# Altium schematic sheet starfish_4.SchDoc: starfish
size 282 x 208 mm; Origin: Eagle; Date: 4/18/2022 11:53:22 PM; SheetNumber: 5; GateName_1: G$1; SymbolName_1: A4L-LOC; LibraryName: frames; DeviceSetName: A4L-LOC; Sheet: Sheet:
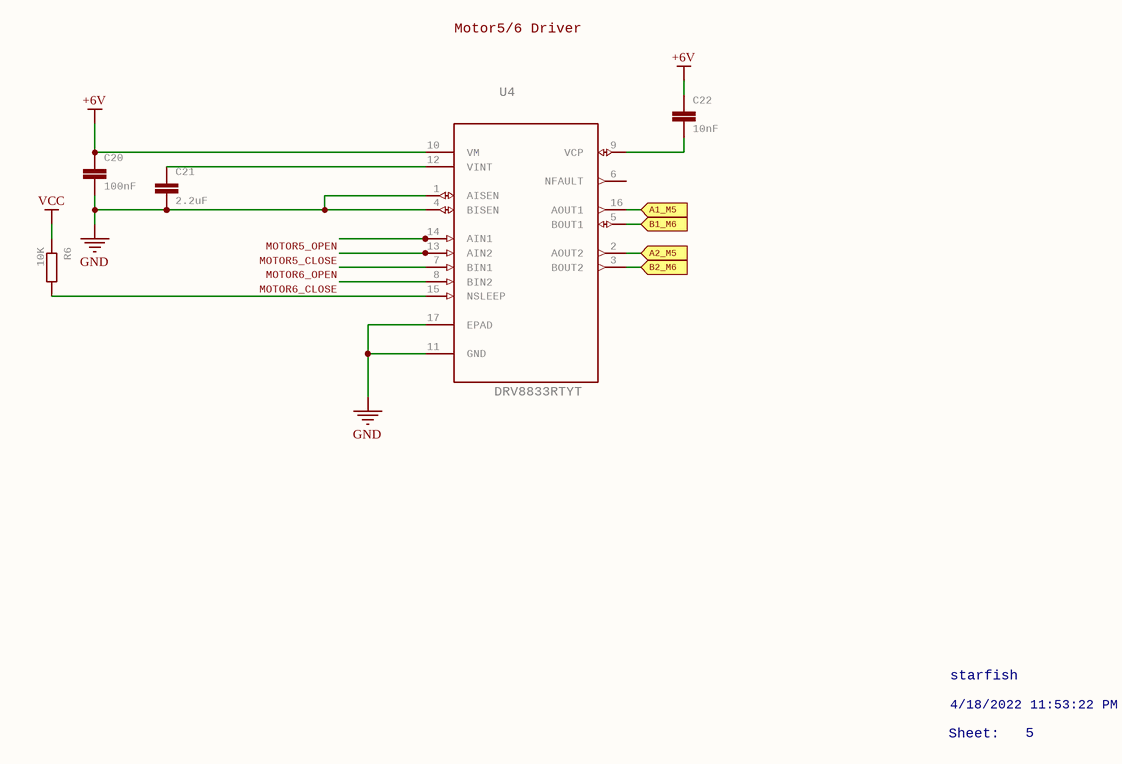
[diagram p0: starfish_4.SchDoc]

## Parts
C20  100nF  [C0603]
C21  2.2uF  [C0603]
C22  10nF  [C0603]
R6  10K  [R0603]
U4  DRV8833RTYT  [QFN65P400X400X80-17N]

## Ports
A1_M5 (in), A2_M5 (in), B1_M6 (in), B2_M6 (in)

## Nets
+6V: C20.1 C22.1 U4.10(VM)
GND: C20.2 C21.2 U4.1(AISEN) U4.4(BISEN) U4.11(GND) U4.17(EPAD)
VCC: R6.1
A1_M5: U4.16(AOUT1) ; port A1_M5
A2_M5: U4.2(AOUT2) ; port A2_M5
B1_M6: U4.5(BOUT1) ; port B1_M6
B2_M6: U4.3(BOUT2) ; port B2_M6
MOTOR5_CLOSE: U4.13(AIN2)
MOTOR5_OPEN: U4.14(AIN1)
MOTOR6_CLOSE: U4.8(BIN2)
MOTOR6_OPEN: U4.7(BIN1)
NetC21_1: C21.1 U4.12(VINT)
NetC22_2: C22.2 U4.9(VCP)
NetR6_2: R6.2 U4.15(NSLEEP)

Not connected (* = marked no-connect by the designer): U4 6(NFAULT)

## Notes on the sheet
- Motor5/6 Driver
- starfish
- Sheet:
- 4/18/2022 11:53:22 PM
- 5

## Library data of the parts
C20-C22 = C-EUC0603: CAPACITOR, European symbol; GateName_1: G$1; SymbolName_1: C-EU; DeviceName: C0603; LibraryName: resistor; DeviceSetName: C-EU
R6 = R-EU_R0603: RESISTOR, European symbol; GateName_1: G$1; SymbolName_1: R-EU; DeviceSetName: R-EU_; DeviceName: R0603; LibraryName: resistor
U4 = DRV8833RTYT: DUAL H-BRIDGE MOTOR DRIVER,QFN-16; GateName_1: A; SymbolName_1: DRV8833RTYT; LibraryName: DRV8833RTYT; DeviceSetName: DRV8833RTYT; MPN: DRV8833RTYT; OC_FARNELL: 2057087; OC_NEWARK: 64T2942; PACKAGE: QFN-16; SUPPLIER: TEXAS INSTRUMENTS